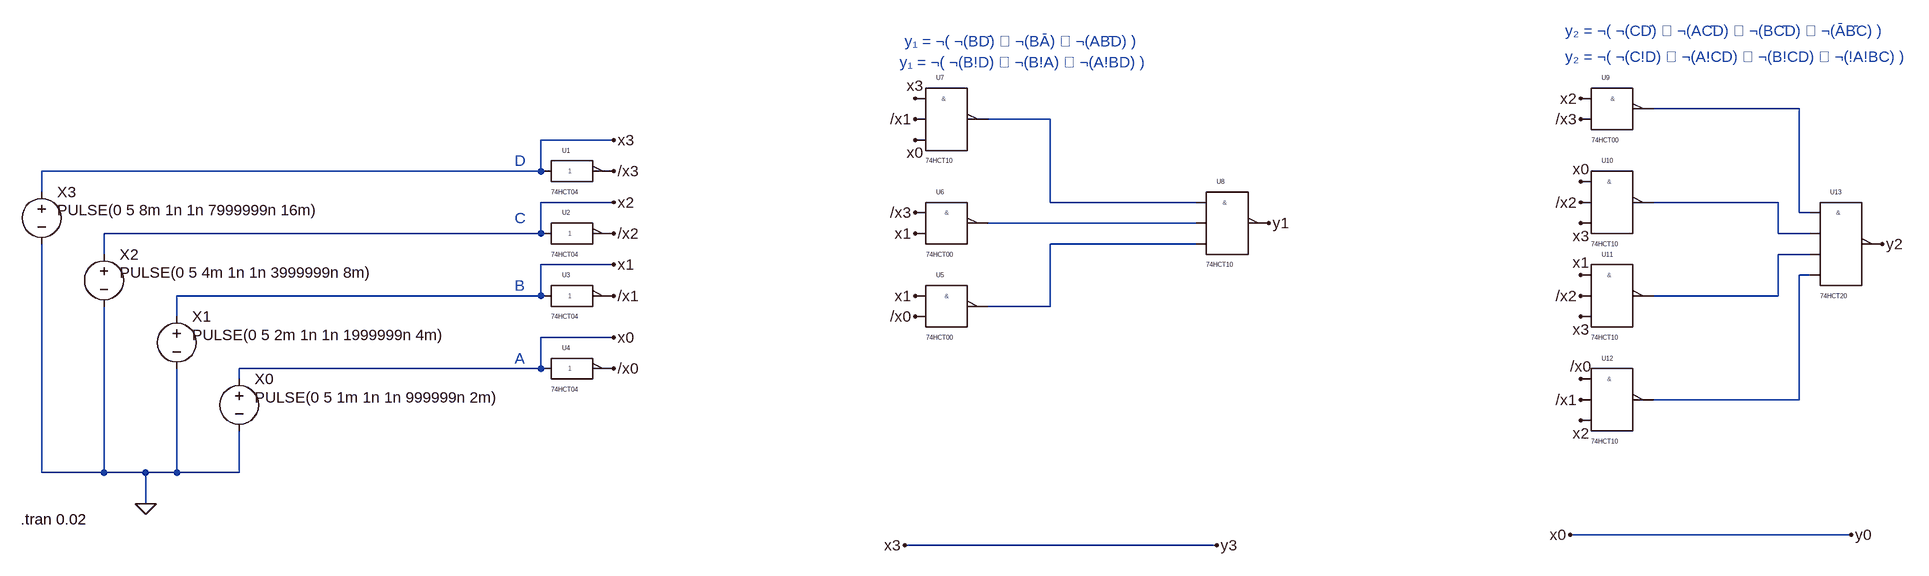
[diagram p0: schematic P3.asc]
P3.asc, the LTspice schematic file:
Version 4.1
SHEET 1 2776 680
WIRE 2528 -288 2304 -288
WIRE 1376 -272 1280 -272
WIRE 704 -240 592 -240
WIRE 592 -192 592 -240
WIRE 592 -192 -176 -192
WIRE -176 -160 -176 -192
WIRE 704 -144 592 -144
WIRE 1376 -144 1376 -272
WIRE 1600 -144 1376 -144
WIRE 2496 -144 2304 -144
WIRE 2528 -128 2528 -288
WIRE 2544 -128 2528 -128
WIRE 1600 -112 1280 -112
WIRE 592 -96 592 -144
WIRE 592 -96 -80 -96
WIRE 2496 -96 2496 -144
WIRE 2544 -96 2496 -96
WIRE 1600 -80 1376 -80
WIRE -80 -64 -80 -96
WIRE 2544 -64 2496 -64
WIRE 704 -48 592 -48
WIRE 2544 -32 2528 -32
WIRE 592 0 592 -48
WIRE 592 0 32 0
WIRE 2496 0 2496 -64
WIRE 2496 0 2304 0
WIRE 1376 16 1376 -80
WIRE 1376 16 1280 16
WIRE 32 32 32 0
WIRE 704 64 592 64
WIRE 592 112 592 64
WIRE 592 112 128 112
WIRE 128 128 128 112
WIRE 2528 160 2528 -32
WIRE 2528 160 2304 160
WIRE -176 272 -176 -80
WIRE -80 272 -80 16
WIRE -80 272 -176 272
WIRE -16 272 -80 272
WIRE 32 272 32 112
WIRE 32 272 -16 272
WIRE 128 272 128 208
WIRE 128 272 32 272
WIRE -16 320 -16 272
WIRE 2608 368 2176 368
WIRE 1632 384 1152 384
FLAG -16 320 0
FLAG 704 0 /x1
FLAG 704 -48 x1
FLAG 704 112 /x0
FLAG 704 64 x0
FLAG 704 -96 /x2
FLAG 704 -144 x2
FLAG 704 -240 x3
FLAG 704 -192 /x3
FLAG 1168 -128 /x3
FLAG 1168 -96 x1
FLAG 1168 32 /x0
FLAG 1168 0 x1
FLAG 1168 -240 x0
FLAG 1168 -272 /x1
FLAG 1168 -304 x3
FLAG 1712 -112 y1
FLAG 2192 -304 x2
FLAG 2192 -272 /x3
FLAG 2192 -176 x0
FLAG 2192 -144 /x2
FLAG 2192 -112 x3
FLAG 2192 -32 x1
FLAG 2192 0 /x2
FLAG 2192 32 x3
FLAG 2192 128 /x0
FLAG 2192 160 /x1
FLAG 2192 192 x2
FLAG 2656 -80 y2
FLAG 1152 384 x3
FLAG 1632 384 y3
FLAG 2176 368 x0
FLAG 2608 368 y0
SYMBOL voltage 128 112 R0
WINDOW 3 24 44 Left 2
WINDOW 123 0 0 Left 0
WINDOW 39 0 0 Left 0
SYMATTR Value PULSE(0 5 1m 1n 1n 999999n 2m)
SYMATTR InstName X0
SYMBOL voltage 32 16 R0
WINDOW 3 24 44 Left 2
WINDOW 123 0 0 Left 0
WINDOW 39 0 0 Left 0
SYMATTR Value PULSE(0 5 2m 1n 1n 1999999n 4m)
SYMATTR InstName X1
SYMBOL voltage -80 -80 R0
WINDOW 3 24 44 Left 2
WINDOW 123 0 0 Left 0
WINDOW 39 0 0 Left 0
SYMATTR Value PULSE(0 5 4m 1n 1n 3999999n 8m)
SYMATTR InstName X2
SYMBOL voltage -176 -176 R0
WINDOW 3 24 44 Left 2
WINDOW 123 0 0 Left 0
WINDOW 39 0 0 Left 0
SYMATTR Value PULSE(0 5 8m 1n 1n 7999999n 16m)
SYMATTR InstName X3
SYMBOL 74HCT\\74hct04.i 640 -240 R0
SYMATTR InstName U1
SYMBOL 74HCT\\74hct04.i 640 -144 R0
SYMATTR InstName U2
SYMBOL 74HCT\\74hct04.i 640 -48 R0
SYMATTR InstName U3
SYMBOL 74HCT\\74hct04.i 640 64 R0
SYMATTR InstName U4
SYMBOL 74HCT\\74hct00.i 1216 -48 R0
SYMATTR InstName U5
SYMBOL 74HCT\\74hct00.i 1216 -176 R0
SYMATTR InstName U6
SYMBOL 74HCT\\74hct10.i 1216 -352 R0
SYMATTR InstName U7
SYMBOL 74HCT\\74hct10.i 1648 -192 R0
SYMATTR InstName U8
SYMBOL 74HCT\\74hct10.i 2240 -224 R0
SYMATTR InstName U10
SYMBOL 74HCT\\74hct10.i 2240 -80 R0
SYMATTR InstName U11
SYMBOL 74HCT\\74hct10.i 2240 80 R0
SYMATTR InstName U12
SYMBOL 74HCT\\74hct00.i 2240 -352 R0
SYMATTR InstName U9
SYMBOL 74HCT\\74hct20.i 2592 -176 R0
SYMATTR InstName U13
TEXT -208 344 Left 2 !.tran 0.02
TEXT 552 96 Left 2 ;A
TEXT 552 -16 Left 2 ;B
TEXT 552 -120 Left 2 ;C
TEXT 552 -208 Left 2 ;D
TEXT 1152 -392 Left 2 ;y₁ = ¬( ¬(BD̄) ∧ ¬(BĀ) ∧ ¬(AB̄D) )
TEXT 1144 -360 Left 2 ;y₁ = ¬( ¬(B!D) ∧ ¬(B!A) ∧ ¬(A!BD) )
TEXT 2168 -408 Left 2 ;y₂ = ¬( ¬(CD̄) ∧ ¬(AC̄D) ∧ ¬(BC̄D) ∧ ¬(ĀB̄C) )
TEXT 2168 -368 Left 2 ;y₂ = ¬( ¬(C!D) ∧ ¬(A!CD) ∧ ¬(B!CD) ∧ ¬(!A!BC) )

The netlist it stands for:
* P3.asc
V§X0 y0 0 PULSE(0 5 1m 1n 1n 999999n 2m)
V§X1 x1 0 PULSE(0 5 2m 1n 1n 1999999n 4m)
V§X2 x2 0 PULSE(0 5 4m 1n 1n 3999999n 8m)
V§X3 y3 0 PULSE(0 5 8m 1n 1n 7999999n 16m)
X§U1 y3 /x3 VCC 0 74HCT04 VCC=5  SPEED=1.0  TRIPDT=1e-9  ; pins A Y
X§U2 x2 /x2 VCC 0 74HCT04 VCC=5  SPEED=1.0  TRIPDT=1e-9  ; pins A Y
X§U3 x1 /x1 VCC 0 74HCT04 VCC=5  SPEED=1.0  TRIPDT=1e-9  ; pins A Y
X§U4 y0 /x0 VCC 0 74HCT04 VCC=5  SPEED=1.0  TRIPDT=1e-9  ; pins A Y
X§U5 x1 /x0 N005 VCC 0 74HCT00 VCC=5  SPEED=1.0  TRIPDT=1e-9  ; pins A B Y
X§U6 /x3 x1 N004 VCC 0 74HCT00 VCC=5  SPEED=1.0  TRIPDT=1e-9  ; pins A B Y
X§U7 y3 /x1 y0 N002 VCC 0 74HCT10 VCC=5  SPEED=1.0  TRIPDT=1e-9  ; pins A B C Y
X§U8 N002 N004 N005 y1 VCC 0 74HCT10 VCC=5  SPEED=1.0  TRIPDT=1e-9  ; pins A B C Y
X§U10 y0 /x2 y3 N003 VCC 0 74HCT10 VCC=5  SPEED=1.0  TRIPDT=1e-9  ; pins A B C Y
X§U11 x1 /x2 y3 N006 VCC 0 74HCT10 VCC=5  SPEED=1.0  TRIPDT=1e-9  ; pins A B C Y
X§U12 /x0 /x1 x2 N007 VCC 0 74HCT10 VCC=5  SPEED=1.0  TRIPDT=1e-9  ; pins A B C Y
X§U9 x2 /x3 N001 VCC 0 74HCT00 VCC=5  SPEED=1.0  TRIPDT=1e-9  ; pins A B Y
X§U13 N001 N003 N006 N007 y2 VCC 0 74HCT20 VCC=5  SPEED=1.0  TRIPDT=1e-9  ; pins A B C D Y
.tran 0.02
* A
* B
* C
* D
* y₁ = ¬( ¬(BD̄) ∧ ¬(BĀ) ∧ ¬(AB̄D) )
* y₁ = ¬( ¬(B!D) ∧ ¬(B!A) ∧ ¬(A!BD) )
* y₂ = ¬( ¬(CD̄) ∧ ¬(AC̄D) ∧ ¬(BC̄D) ∧ ¬(ĀB̄C) )
* y₂ = ¬( ¬(C!D) ∧ ¬(A!CD) ∧ ¬(B!CD) ∧ ¬(!A!BC) )
.lib ../sym/EXTRA/74HCT/74hct.lib
.backanno
.end